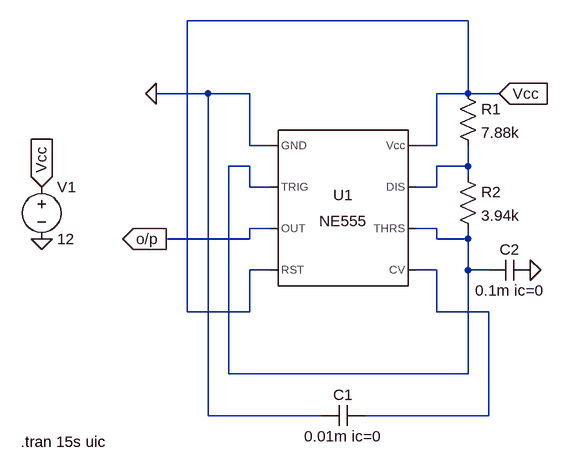
[diagram p0: schematic astable_multivibrator.asc]
astable_multivibrator.asc, the LTspice schematic file:
Version 4.1
SHEET 1 880 848
WIRE 448 -176 16 -176
WIRE 48 -64 -32 -64
WIRE 112 -64 48 -64
WIRE 448 -64 448 -176
WIRE 448 -64 400 -64
WIRE 496 -64 448 -64
WIRE 112 16 112 -64
WIRE 144 16 112 16
WIRE 400 16 400 -64
WIRE 400 16 368 16
WIRE 112 48 80 48
WIRE 448 48 448 16
WIRE 448 48 400 48
WIRE 448 64 448 48
WIRE 112 80 112 48
WIRE 144 80 112 80
WIRE 400 80 400 48
WIRE 400 80 368 80
WIRE 144 144 112 144
WIRE 400 144 368 144
WIRE 112 160 112 144
WIRE 112 160 -16 160
WIRE 400 160 400 144
WIRE 448 160 448 144
WIRE 448 160 400 160
WIRE 144 208 112 208
WIRE 400 208 368 208
WIRE 448 208 448 160
WIRE 480 208 448 208
WIRE 16 272 16 -176
WIRE 112 272 112 208
WIRE 112 272 16 272
WIRE 400 272 400 208
WIRE 480 272 400 272
WIRE 80 368 80 48
WIRE 448 368 448 208
WIRE 448 368 80 368
WIRE 48 432 48 -64
WIRE 224 432 48 432
WIRE 480 432 480 272
WIRE 480 432 288 432
FLAG -32 -64 0
FLAG -16 160 o/p
IOPIN -16 160 Out
FLAG 496 -64 Vcc
IOPIN 496 -64 In
FLAG 544 208 0
FLAG -208 160 0
FLAG -208 80 Vcc
IOPIN -208 80 In
SYMBOL cap 288 416 R90
WINDOW 0 0 32 VBottom 2
WINDOW 3 32 32 VTop 2
SYMATTR InstName C1
SYMATTR Value 0.01m ic=0
SYMBOL res 432 -80 R0
SYMATTR InstName R1
SYMATTR Value 7.88k
SYMBOL res 432 48 R0
SYMATTR InstName R2
SYMATTR Value 3.94k
SYMBOL cap 544 192 R90
WINDOW 0 0 32 VBottom 2
WINDOW 3 32 32 VTop 2
SYMATTR InstName C2
SYMATTR Value 0.1m ic=0
SYMBOL voltage -208 64 R0
WINDOW 123 0 0 Left 0
WINDOW 39 0 0 Left 0
SYMATTR InstName V1
SYMATTR Value 12
SYMBOL Misc\\NE555 256 112 R0
SYMATTR InstName U1
TEXT -240 472 Left 2 !.tran 15s uic

The netlist it stands for:
* astable_multivibrator.asc
C1 N003 0 0.01m ic=0
R1 Vcc N002 7.88k
R2 N002 N001 3.94k
C2 0 N001 0.1m ic=0
V1 Vcc 0 12
X§U1 0 N001 o/p Vcc N003 N001 N002 Vcc NE555  ; pins GND TRIG OUT RST CV THRS DIS Vcc
.tran 15s uic
.lib NE555.sub
.backanno
.end